# Altium schematic sheet Power_Hi_Curr.SchDoc
size A3; Organization: Altium Limited; Address1: L3, 12a Rodborough Rd; Address2: Frenchs Forest; Address3: NSW; Address4: Australia 2086
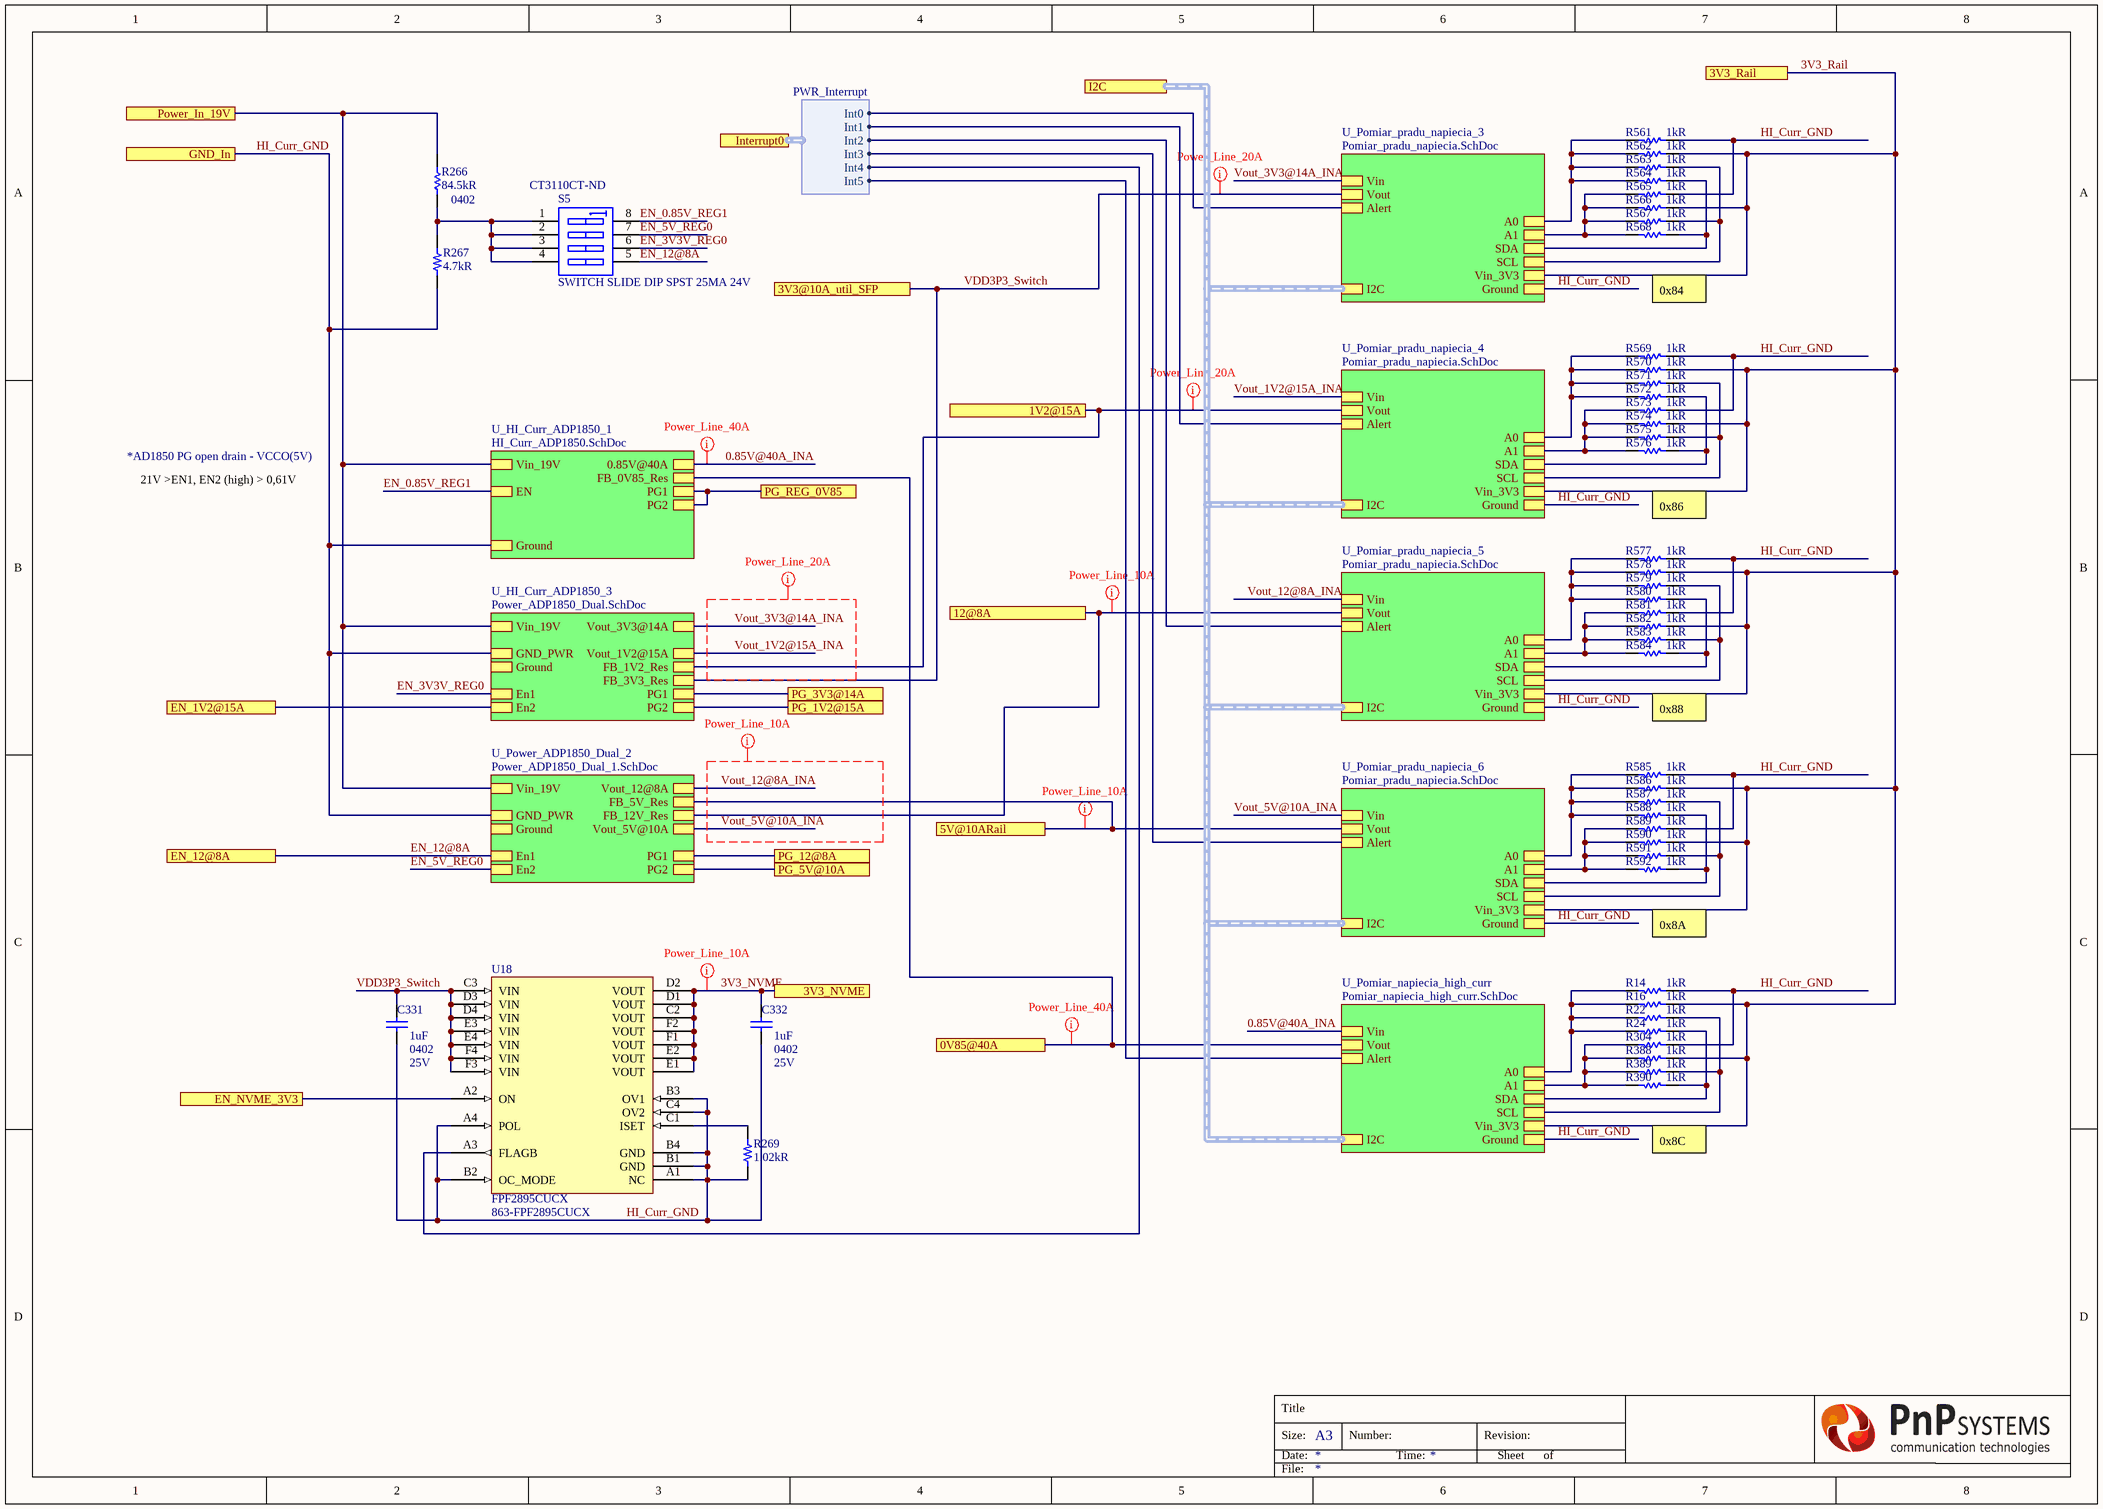
[diagram p0: Power_Hi_Curr.SchDoc]

## Parts
C331  1uF  Case/Package: 0402  Voltage Rating: 25V  [CAP 0402/1005 KK]
C332  1uF  Case/Package: 0402  Voltage Rating: 25V  [CAP 0402/1005 KK]
R14  1kR  [RES 0402/1005 RF KK]
R16  1kR  [RES 0402/1005 RF KK]
R22  1kR  [RES 0402/1005 RF KK]
R24  1kR  [RES 0402/1005 RF KK]
R266  84.5kR  Case/Package: 0402  [RES 0402/1005 RF KK]
R267  4.7kR  [RES 0402/1005 RF KK]
R269  1.02kR  [RES 0402/1005 RF KK]
R304  1kR  [RES 0402/1005 RF KK]
R388  1kR  [RES 0402/1005 RF KK]
R389  1kR  [RES 0402/1005 RF KK]
R390  1kR  [RES 0402/1005 RF KK]
R561  1kR  [RES 0402/1005 RF KK]
R562  1kR  [RES 0402/1005 RF KK]
R563  1kR  [RES 0402/1005 RF KK]
R564  1kR  [RES 0402/1005 RF KK]
R565  1kR  [RES 0402/1005 RF KK]
R566  1kR  [RES 0402/1005 RF KK]
R567  1kR  [RES 0402/1005 RF KK]
R568  1kR  [RES 0402/1005 RF KK]
R569  1kR  [RES 0402/1005 RF KK]
R570  1kR  [RES 0402/1005 RF KK]
R571  1kR  [RES 0402/1005 RF KK]
R572  1kR  [RES 0402/1005 RF KK]
R573  1kR  [RES 0402/1005 RF KK]
R574  1kR  [RES 0402/1005 RF KK]
R575  1kR  [RES 0402/1005 RF KK]
R576  1kR  [RES 0402/1005 RF KK]
R577  1kR  [RES 0402/1005 RF KK]
R578  1kR  [RES 0402/1005 RF KK]
R579  1kR  [RES 0402/1005 RF KK]
R580  1kR  [RES 0402/1005 RF KK]
R581  1kR  [RES 0402/1005 RF KK]
R582  1kR  [RES 0402/1005 RF KK]
R583  1kR  [RES 0402/1005 RF KK]
R584  1kR  [RES 0402/1005 RF KK]
R585  1kR  [RES 0402/1005 RF KK]
R586  1kR  [RES 0402/1005 RF KK]
R587  1kR  [RES 0402/1005 RF KK]
R588  1kR  [RES 0402/1005 RF KK]
R589  1kR  [RES 0402/1005 RF KK]
R590  1kR  [RES 0402/1005 RF KK]
R591  1kR  [RES 0402/1005 RF KK]
R592  1kR  [RES 0402/1005 RF KK]
S5  SWITCH SLIDE DIP SPST 25MA 24V  Supplier Part Number 1: CT3110CT-ND  [SO8_N]
U18  FPF2895CUCX  Supplier Part Number 1: 863-FPF2895CUCX  [FPF2895C-D]

## Sub-sheets
U_HI_Curr_ADP1850_1 = HI_Curr_ADP1850.SchDoc: Ground, Vin_19V, PG2, PG1, 0.85V@40A, EN, FB_0V85_Res
U_HI_Curr_ADP1850_3 = Power_ADP1850_Dual.SchDoc: Ground, Vin_19V, GND_PWR, En2, En1, Vout_1V2@15A, PG2, PG1, Vout_3V3@14A, FB_1V2_Res, FB_3V3_Res
U_Pomiar_napiecia_high_curr = Pomiar_napiecia_high_curr.SchDoc: Vin_3V3, Vin, Vout, Alert, A0, A1, SDA, SCL, Ground, I2C (harness I2C)
U_Pomiar_pradu_napiecia_3 = Pomiar_pradu_napiecia.SchDoc: Vin_3V3, Vin, Vout, Alert, A0, A1, SDA, SCL, Ground, I2C (harness I2C)
U_Pomiar_pradu_napiecia_4 = Pomiar_pradu_napiecia.SchDoc: Vin_3V3, Vin, Vout, Alert, A0, A1, SDA, SCL, Ground, I2C (harness I2C)
U_Pomiar_pradu_napiecia_5 = Pomiar_pradu_napiecia.SchDoc: Vin_3V3, Vin, Vout, Alert, A0, A1, SDA, SCL, Ground, I2C (harness I2C)
U_Pomiar_pradu_napiecia_6 = Pomiar_pradu_napiecia.SchDoc: Vin_3V3, Vin, Vout, Alert, A0, A1, SDA, SCL, Ground, I2C (harness I2C)
U_Power_ADP1850_Dual_2 = Power_ADP1850_Dual_1.SchDoc: Vin_19V, Ground, GND_PWR, En1, En2, PG1, PG2, Vout_12@8A, Vout_5V@10A, FB_5V_Res, FB_12V_Res

## Ports
0V85@40A, 1V2@15A, 3V3@10A_util_SFP, 3V3_NVME, 3V3_Rail, 5V@10ARail, 12@8A, EN_1V2@15A, EN_12@8A, EN_NVME_3V3, GND_In, I2C (harness I2C), Interrupt0 (harness PWR_Interrupt), PG_1V2@15A, PG_3V3@14A, PG_5V@10A, PG_12@8A, PG_REG_0V85, Power_In_19V

## Harnesses
PWR_Interrupt: Int0, Int1, Int2, Int3, Int4, Int5

## Nets
0.85V@40A_INA: sheet U_HI_Curr_ADP1850_1/0.85V@40A, sheet U_Pomiar_napiecia_high_curr/Vin
0V85@40A: port 0V85@40A, sheet U_HI_Curr_ADP1850_1/FB_0V85_Res, sheet U_Pomiar_napiecia_high_curr/Vout
1V2@15A: port 1V2@15A, sheet U_HI_Curr_ADP1850_3/FB_1V2_Res, sheet U_Pomiar_pradu_napiecia_4/Vout
3V3_NVME: C332.1 U18.C2(VOUT) U18.D1(VOUT) U18.D2(VOUT) U18.E1(VOUT) U18.E2(VOUT) U18.F1(VOUT) U18.F2(VOUT) ; port 3V3_NVME
3V3_Rail: R16.2 R388.2 R562.2 R566.2 R570.2 R574.2 R578.2 R582.2 R586.2 R590.2 ; port 3V3_Rail, sheet U_Pomiar_pradu_napiecia_3/Vin_3V3, sheet U_Pomiar_pradu_napiecia_4/Vin_3V3, sheet U_Pomiar_pradu_napiecia_5/Vin_3V3, sheet U_Pomiar_pradu_napiecia_6/Vin_3V3, sheet U_Pomiar_napiecia_high_curr/Vin_3V3
5V@10ARail: port 5V@10ARail, sheet U_Power_ADP1850_Dual_2/FB_5V_Res, sheet U_Pomiar_pradu_napiecia_6/Vout
12@8A: port 12@8A, sheet U_Power_ADP1850_Dual_2/FB_12V_Res, sheet U_Pomiar_pradu_napiecia_5/Vout
EN_0.85V_REG1: S5.8(B1) ; sheet U_HI_Curr_ADP1850_1/EN
EN_1V2@15A: port EN_1V2@15A, sheet U_HI_Curr_ADP1850_3/En2
EN_3V3V_REG0: S5.6(B3) ; sheet U_HI_Curr_ADP1850_3/En1
EN_5V_REG0: S5.7(B2) ; sheet U_Power_ADP1850_Dual_2/En2
EN_12@8A: S5.5(B4) ; port EN_12@8A, sheet U_Power_ADP1850_Dual_2/En1
EN_NVME_3V3: U18.A2(ON) ; port EN_NVME_3V3
HI_Curr_GND: C331.2 C332.2 R14.2 R267.1 R269.1 R304.2 R561.2 R565.2 R569.2 R573.2 R577.2 R581.2 R585.2 R589.2 U18.A1(NC) U18.A4(POL) U18.B1(GND) U18.B2(OC_MODE) U18.B3(OV1) U18.B4(GND) U18.C4(OV2) ; port GND_In, sheet U_HI_Curr_ADP1850_1/Ground, sheet U_HI_Curr_ADP1850_3/GND_PWR, sheet U_Power_ADP1850_Dual_2/GND_PWR, sheet U_Pomiar_pradu_napiecia_3/Ground, sheet U_Pomiar_pradu_napiecia_4/Ground, sheet U_Pomiar_pradu_napiecia_5/Ground, sheet U_Pomiar_pradu_napiecia_6/Ground, sheet U_Pomiar_napiecia_high_curr/Ground
PG_1V2@15A: port PG_1V2@15A, sheet U_HI_Curr_ADP1850_3/PG2
PG_3V3@14A: port PG_3V3@14A, sheet U_HI_Curr_ADP1850_3/PG1
PG_5V@10A: port PG_5V@10A, sheet U_Power_ADP1850_Dual_2/PG2
PG_12@8A: port PG_12@8A, sheet U_Power_ADP1850_Dual_2/PG1
PG_REG_0V85: port PG_REG_0V85, sheet U_HI_Curr_ADP1850_1/PG2, sheet U_HI_Curr_ADP1850_1/PG1
Power_In_19V: R266.2 ; port Power_In_19V, sheet U_HI_Curr_ADP1850_1/Vin_19V, sheet U_HI_Curr_ADP1850_3/Vin_19V, sheet U_Power_ADP1850_Dual_2/Vin_19V
VDD3P3_Switch: C331.1 U18.C3(VIN) U18.D3(VIN) U18.D4(VIN) U18.E3(VIN) U18.E4(VIN) U18.F3(VIN) U18.F4(VIN) ; port 3V3@10A_util_SFP, sheet U_HI_Curr_ADP1850_3/FB_3V3_Res, sheet U_Pomiar_pradu_napiecia_3/Vout
Vout_1V2@15A_INA: sheet U_HI_Curr_ADP1850_3/Vout_1V2@15A, sheet U_Pomiar_pradu_napiecia_4/Vin
Vout_3V3@14A_INA: sheet U_HI_Curr_ADP1850_3/Vout_3V3@14A, sheet U_Pomiar_pradu_napiecia_3/Vin
Vout_5V@10A_INA: sheet U_Power_ADP1850_Dual_2/Vout_5V@10A, sheet U_Pomiar_pradu_napiecia_6/Vin
Vout_12@8A_INA: sheet U_Power_ADP1850_Dual_2/Vout_12@8A, sheet U_Pomiar_pradu_napiecia_5/Vin
NetR14_1: R14.1 R16.1 R22.1 R24.1 ; sheet U_Pomiar_napiecia_high_curr/A0
NetR22_2: R22.2 R389.2 ; sheet U_Pomiar_napiecia_high_curr/SCL
NetR24_2: R24.2 R390.2 ; sheet U_Pomiar_napiecia_high_curr/SDA
NetR266_1: R266.1 R267.2 S5.1(A1) S5.2(A2) S5.3(A3) S5.4(A4)
NetR269_2: R269.2 U18.C1(ISET)
NetR304_1: R304.1 R388.1 R389.1 R390.1 ; sheet U_Pomiar_napiecia_high_curr/A1
NetR561_1: R561.1 R562.1 R563.1 R564.1 ; sheet U_Pomiar_pradu_napiecia_3/A0
NetR563_2: R563.2 R567.2 ; sheet U_Pomiar_pradu_napiecia_3/SCL
NetR564_2: R564.2 R568.2 ; sheet U_Pomiar_pradu_napiecia_3/SDA
NetR565_1: R565.1 R566.1 R567.1 R568.1 ; sheet U_Pomiar_pradu_napiecia_3/A1
NetR569_1: R569.1 R570.1 R571.1 R572.1 ; sheet U_Pomiar_pradu_napiecia_4/A0
NetR571_2: R571.2 R575.2 ; sheet U_Pomiar_pradu_napiecia_4/SCL
NetR572_2: R572.2 R576.2 ; sheet U_Pomiar_pradu_napiecia_4/SDA
NetR573_1: R573.1 R574.1 R575.1 R576.1 ; sheet U_Pomiar_pradu_napiecia_4/A1
NetR577_1: R577.1 R578.1 R579.1 R580.1 ; sheet U_Pomiar_pradu_napiecia_5/A0
NetR579_2: R579.2 R583.2 ; sheet U_Pomiar_pradu_napiecia_5/SCL
NetR580_2: R580.2 R584.2 ; sheet U_Pomiar_pradu_napiecia_5/SDA
NetR581_1: R581.1 R582.1 R583.1 R584.1 ; sheet U_Pomiar_pradu_napiecia_5/A1
NetR585_1: R585.1 R586.1 R587.1 R588.1 ; sheet U_Pomiar_pradu_napiecia_6/A0
NetR587_2: R587.2 R591.2 ; sheet U_Pomiar_pradu_napiecia_6/SCL
NetR588_2: R588.2 R592.2 ; sheet U_Pomiar_pradu_napiecia_6/SDA
NetR589_1: R589.1 R590.1 R591.1 R592.1 ; sheet U_Pomiar_pradu_napiecia_6/A1
NetU18_A3: U18.A3(FLAGB) ; port Interrupt0.Int4
(unnamed): sheet U_Pomiar_pradu_napiecia_3/Alert, port Interrupt0.Int0
(unnamed): sheet U_Pomiar_pradu_napiecia_4/Alert, port Interrupt0.Int1
(unnamed): sheet U_Pomiar_pradu_napiecia_5/Alert, port Interrupt0.Int2
(unnamed): sheet U_Pomiar_pradu_napiecia_6/Alert, port Interrupt0.Int3
(unnamed): sheet U_Pomiar_napiecia_high_curr/Alert, port Interrupt0.Int5

## Buses and harness runs
harness port I2C = sheet U_Pomiar_napiecia_high_curr/I2C = sheet U_Pomiar_pradu_napiecia_3/I2C = sheet U_Pomiar_pradu_napiecia_4/I2C = sheet U_Pomiar_pradu_napiecia_5/I2C = sheet U_Pomiar_pradu_napiecia_6/I2C

## Layout directives
net class Power_Line_40A: 0.85V@40A_INA, 0V85@40A
net class Power_Line_20A: 1V2@15A, VDD3P3_Switch, Vout_1V2@15A_INA, Vout_3V3@14A_INA
net class Power_Line_10A: 3V3_NVME, 5V@10ARail, 12@8A, Vout_5V@10A_INA, Vout_12@8A_INA

## Notes on the sheet
- 0x84
- *AD1850 PG open drain - VCCO(5V)
- 21V >EN1, EN2 (high) > 0,61V
- 0x86
- 0x88
- 0x8A
- 0x8C
- Title
- Size:
- Date:
- A3
- Number:
- Time:
- Revision:
- Sheet
- of
- File:

## Library data of the parts
C331 C332 = Capacitor: MURATA - GRT155R61E105KE01D - SMD Multilayer Ceramic Capacitor, 1 µF, 25 V, 0402 [1005 Metric], ± 10%, X5R, GRT Series - SMD Multilayer Ceramic Capacitor, 1 µF, 25 V, 0402 [1005 Metric], ± 10%, X5R, GRT Series; Supplier 1: Digi-Key; Supplier Part Number 1: 490-12263-1-ND; Manufacturer: Murata; Manufacturer Part Number: GRT155R61E105KE01D; RoHS: Yes; Category: Ceramic Capacitors; Stock 1: 341453; Pricing 1: 1=0,18000, 10=0,12300, 100=0,06210, 500=0,04248, 1000=0,03758, 2500=0,03594, 5000=0,03268 (USD); Mount: Surface Mount; Case Code (Metric): 1005; Case Code (Imperial): 0402; Min Operating Temperature: -55°C; Max Operating Temperature: 85°C; Packaging: Tape and Reel; Capacitance: 1uF; Tolerance: 10%; Dielectric: X5R; Voltage Rating (DC): 25V; Length: 0.039inch; Width: 0.02inch; Thickness: 0.022inch; Ratings: AEC-Q200; ComponentLink1URL: http://www.farnell.com/datasheets/2165918.pdf?src-supplier=Farnell; ComponentLink1Description: http://www.farnell.com/datasheets/2165918.pdf?src-supplier=Farnell; ComponentLink2URL: http://search.murata.co.jp/Ceramy/image/img/A01X/G101/ENG/GRT155R61E105KE01-01.pdf?src-supplier=Digi-Key; ComponentLink2Description: http://search.murata.co.jp/Ceramy/image/img/A01X/G101/ENG/GRT155R61E105KE01-01.pdf?src-supplier=Digi-Key; ComponentLink3URL: http://www.farnell.com/datasheets/2165918.pdf?src-supplier=Element14; ComponentLink3Description: http://www.farnell.com/datasheets/2165918.pdf?src-supplier=Element14
R14 R16 R22 R24 R304 R388-R390 R561-R592 = Resistor: PANASONIC - ERJ-2RKF1001X - SMD Chip Resistor, 0402 [1005 Metric], 1 kohm, ERJ2R Series, 50 V, Thick Film, 100 mW; Temperature Coefficient: 100ppm/°C; Tolerance: 1%; Voltage Rating (DC): 50V; Power Rating: 100mW; Supplier 1: Digi-Key; Supplier Part Number 1: P1.00KLDKR-ND; Manufacturer: Panasonic; Manufacturer Part Number: ERJ-2RKF1001X; RoHS: Yes; Category: Chip SMD Resistors; Stock 1: 1864188; Pricing 1: 1=0,10000, 10=0,04300, 100=0,01740, 1000=0,00782, 2500=0,00678, 5000=0,00561 (USD); Mount: Surface Mount; Case/Package: 0402; Number of Pins: 2; Contact Plating: Tin; Case Code (Imperial): 0402; Case Code (Metric): 1005; Min Operating Temperature: -55°C; Max Operating Temperature: 155°C; Composition: Thick Film; Resistance: 1kR; Termination: SMD/SMT; Number of Terminations: 2; Military Standard: Not; Features: Automotive AEC-Q200; Packaging: Tape and Reel; Voltage Rating: 50V; Package Quantity: 1; Max Power Dissipation: 100mW; Working Voltage: 50V; Length: 1mm; Height: 0.35mm; Depth: 0.5mm; Width: 0.5mm; Radiation Hardening: No; Lead Free: Lead Free; REACH SVHC: No SVHC; ComponentLink1URL: https://datasheet.ciiva.com/11821/0900766b80f80784-11821203.pdf?src-supplier=RSComponents; ComponentLink1Description: https://datasheet.ciiva.com/11821/0900766b80f80784-11821203.pdf?src-supplier=RSComponents; ComponentLink2URL: https://datasheet.ciiva.com/7942/aoa0000ce2-7942426.pdf?src-supplier=Element14; ComponentLink2Description: https://datasheet.ciiva.com/7942/aoa0000ce2-7942426.pdf?src-supplier=Element14; ComponentLink3URL: https://datasheet.ciiva.com/16523/aoa0000ce2-16523834.pdf?src-supplier=Avnet+Asia; ComponentLink3Description: https://datasheet.ciiva.com/16523/aoa0000ce2-16523834.pdf?src-supplier=Avnet+Asia; ComponentLink4URL: https://datasheet.ciiva.com/17215/aoa0000ce2-17215308.pdf?src-supplier=Avnet+Europe; ComponentLink4Description: https://datasheet.ciiva.com/17215/aoa0000ce2-17215308.pdf?src-supplier=Avnet+Europe; ComponentLink5URL: https://datasheet.ciiva.com/22673/1678782-22673916.pdf?src-supplier=Element14; ComponentLink5Description: https://datasheet.ciiva.com/22673/1678782-22673916.pdf?src-supplier=Element14; ComponentLink6URL: https://datasheet.ciiva.com/28532/1678782-28532109.pdf?src-supplier=Element14; ComponentLink6Description: https://datasheet.ciiva.com/28532/1678782-28532109.pdf?src-supplier=Element14; ComponentLink7URL: https://datasheet.ciiva.com/16767/70260748-16767559.pdf?src-supplier=Allied+Electronics; ComponentLink7Description: https://datasheet.ciiva.com/16767/70260748-16767559.pdf?src-supplier=Allied+Electronics; ComponentLink8URL: https://datasheet.ciiva.com/9198/aoa0000ce2-9198920.pdf?src-supplier=Avnet; ComponentLink8Description: https://datasheet.ciiva.com/9198/aoa0000ce2-9198920.pdf?src-supplier=Avnet; ComponentLink9URL: https://datasheet.ciiva.com/16771/70260748-16771979.pdf?src-supplier=Allied+Electronics; ComponentLink9Description: https://datasheet.ciiva.com/16771/70260748-16771979.pdf?src-supplier=Allied+Electronics
R266 = Resistor: Thick Film Resistors - SMD 84.5K OHM 1%; Manufacturer: Yageo; Manufacturer Part Number: RC0402FR-0784K5L; Power Rating: 62.5mW; Voltage Rating: 50V; Temperature Coefficient: 100ppm/°C; Max Power Dissipation: 63mW; Supplier 1: Digi-Key; Supplier Part Number 1: YAG3245CT-ND; RoHS: Yes; Category: Chip SMD Resistors; Stock 1: 1119527; Pricing 1: 1=0,10000, 10=0,01600, 100=0,00640, 1000=0,00289, 2500=0,00251, 5000=0,00207 (USD); Case Code (Imperial): 0402; Case Code (Metric): 1005; Contact Plating: Tin,Matte; Min Operating Temperature: -55°C; Max Operating Temperature: 155°C; Tolerance: 1%; Packaging: Tape and Reel; Resistance: 84.5kR; Composition: Thick Film; Number of Terminations: 2; Termination: SMD/SMT; Military Standard: Not; Voltage Rating (DC): 50V; Working Voltage: 50V; Features: Moisture Resistant; Length: 1mm; Height: 0.016inch; Width: 0.02inch; Depth: 0.5mm; Lead Free: Lead Free; ComponentLink1URL: https://datasheet.ciiva.com/16743/pyu-rc0402-51-rohs-l-6-r-16743877.pdf?src-supplier=Future+Electronics; ComponentLink1Description: https://datasheet.ciiva.com/16743/pyu-rc0402-51-rohs-l-6-r-16743877.pdf?src-supplier=Future+Electronics; ComponentLink2URL: https://datasheet.ciiva.com/16857/pyu-rc0402-51-rohs-l-6-16857805.pdf?src-supplier=Avnet+Europe; ComponentLink2Description: https://datasheet.ciiva.com/16857/pyu-rc0402-51-rohs-l-6-16857805.pdf?src-supplier=Avnet+Europe; ComponentLink3URL: https://datasheet.ciiva.com/28396/pyu-rc0402-51-rohs-l-6-28396296.pdf?src-supplier=Avnet+Europe; ComponentLink3Description: https://datasheet.ciiva.com/28396/pyu-rc0402-51-rohs-l-6-28396296.pdf?src-supplier=Avnet+Europe; ComponentLink4URL: https://datasheet.ciiva.com/8888/pyu-rc0402-51-rohs-l-6-8888111.pdf?src-supplier=Avnet; ComponentLink4Description: https://datasheet.ciiva.com/8888/pyu-rc0402-51-rohs-l-6-8888111.pdf?src-supplier=Avnet
R267 = Resistor: Manufacturer: Panasonic; Manufacturer Part Number: ERJ-2RKF4701X; Tolerance: 1%; Temperature Coefficient: 100ppm/°C; Power Rating: 100mW; Voltage Rating: 50V; Supplier 1: Digi-Key; Supplier Part Number 1: P4.70KLCT-ND; Stock 1: 5361977; Pricing 1: 1 = 0,10000, 10 = 0,05500, 100 = 0,02250, 1000 = 0,01009, 2500 = 0,00876, 5000 = 0,00724 (USD); RoHS: Yes; Mount: Surface Mount; Case/Package: 0402; Number of Pins: 2; Case Code (Imperial): 0402; Case Code (Metric): 1005; Contact Plating: Tin; Min Operating Temperature: -55°C; Max Operating Temperature: 155°C; Resistance: 4.7kR; Packaging: Tape and Reel; Composition: Thick Film; Package Quantity: 1; Termination: SMD/SMT; Voltage Rating (DC): 50V; Number of Terminations: 2; Military Standard: Not; Max Power Dissipation: 100mW; Features: Automotive AEC-Q200; Length: 1mm; Height: 0.35mm; Width: 0.02inch; Depth: 0.5mm; Radiation Hardening: No; Lead Free: Lead Free; REACH SVHC: No SVHC; ComponentLink1URL: https://datasheet.ciiva.com/11821/0900766b80f80784-11821329.pdf?src-supplier=RSComponents; ComponentLink1Description: https://datasheet.ciiva.com/11821/0900766b80f80784-11821329.pdf?src-supplier=RSComponents; ComponentLink2URL: https://datasheet.ciiva.com/30053/aoa0000ce2-30053990.pdf?src-supplier=Onlinecomponents.com; ComponentLink2Description: https://datasheet.ciiva.com/30053/aoa0000ce2-30053990.pdf?src-supplier=Onlinecomponents.com; ComponentLink3URL: https://datasheet.ciiva.com/7830/aoa0000ce2-7830727.pdf?src-supplier=Element14; ComponentLink3Description: https://datasheet.ciiva.com/7830/aoa0000ce2-7830727.pdf?src-supplier=Element14; ComponentLink4URL: https://datasheet.ciiva.com/22781/1678782-22781576.pdf?src-supplier=Farnell; ComponentLink4Description: https://datasheet.ciiva.com/22781/1678782-22781576.pdf?src-supplier=Farnell; ComponentLink5URL: https://datasheet.ciiva.com/9195/aoa0000ce2-9195737.pdf?src-supplier=Avnet; ComponentLink5Description: https://datasheet.ciiva.com/9195/aoa0000ce2-9195737.pdf?src-supplier=Avnet; ComponentLink6URL: https://datasheet.ciiva.com/17213/aoa0000ce2-17213180.pdf?src-supplier=Avnet+Europe; ComponentLink6Description: https://datasheet.ciiva.com/17213/aoa0000ce2-17213180.pdf?src-supplier=Avnet+Europe; ComponentLink7URL: https://datasheet.ciiva.com/22667/1678782-22667886.pdf?src-supplier=Element14; ComponentLink7Description: https://datasheet.ciiva.com/22667/1678782-22667886.pdf?src-supplier=Element14; ComponentLink8URL: https://datasheet.ciiva.com/16763/70260748-16763151.pdf?src-supplier=Allied+Electronics; ComponentLink8Description: https://datasheet.ciiva.com/16763/70260748-16763151.pdf?src-supplier=Allied+Electronics; ComponentLink9URL: https://datasheet.ciiva.com/22723/1678782-22723903.pdf?src-supplier=Element14; ComponentLink9Description: https://datasheet.ciiva.com/22723/1678782-22723903.pdf?src-supplier=Element14; ComponentLink10URL: https://datasheet.ciiva.com/24025/aoa0000ce2-24025663.pdf?src-supplier=Mouser; ComponentLink10Description: https://datasheet.ciiva.com/24025/aoa0000ce2-24025663.pdf?src-supplier=Mouser
R269 = Resistor: Manufacturer: Panasonic; Manufacturer Part Number: ERJ-2RKF1021X; Tolerance: 1%; Temperature Coefficient: 100ppm/°C; Power Rating: 100mW; Voltage Rating: 50V; Supplier 1: Digi-Key; Supplier Part Number 1: P1.02KLCT-ND; Stock 1: 88589; Pricing 1: 1 = 0,10000, 10 = 0,04300, 100 = 0,01750, 1000 = 0,00787, 2500 = 0,00683, 5000 = 0,00564 (USD); RoHS: Yes; Mount: Surface Mount; Case/Package: 0402; Case Code (Metric): 1005; Case Code (Imperial): 0402; Contact Plating: Tin; Min Operating Temperature: -55°C; Max Operating Temperature: 155°C; Resistance: 1.02kR; Packaging: Tape and Reel; Composition: Thick Film; Number of Terminations: 2; Voltage Rating (DC): 50V; Max Power Dissipation: 100mW; Features: Automotive AEC-Q200; Package Quantity: 1; Termination: SMD/SMT; Military Standard: Not; Length: 1mm; Height: 0.35mm; Width: 0.02inch; Depth: 0.5mm; REACH SVHC: No SVHC; Lead Free: Lead Free; ComponentLink1URL: https://datasheet.ciiva.com/16760/70260748-16760677.pdf?src-supplier=Allied+Electronics; ComponentLink1Description: https://datasheet.ciiva.com/16760/70260748-16760677.pdf?src-supplier=Allied+Electronics; ComponentLink2URL: https://datasheet.ciiva.com/24026/aoa0000ce2-24026598.pdf?src-supplier=Mouser; ComponentLink2Description: https://datasheet.ciiva.com/24026/aoa0000ce2-24026598.pdf?src-supplier=Mouser; ComponentLink3URL: https://datasheet.ciiva.com/22743/1678782-22743480.pdf?src-supplier=Farnell; ComponentLink3Description: https://datasheet.ciiva.com/22743/1678782-22743480.pdf?src-supplier=Farnell; ComponentLink4URL: https://datasheet.ciiva.com/16778/70260748-16778748.pdf?src-supplier=Allied+Electronics; ComponentLink4Description: https://datasheet.ciiva.com/16778/70260748-16778748.pdf?src-supplier=Allied+Electronics; ComponentLink5URL: https://datasheet.ciiva.com/22682/1678782-22682413.pdf?src-supplier=Element14; ComponentLink5Description: https://datasheet.ciiva.com/22682/1678782-22682413.pdf?src-supplier=Element14; ComponentLink6URL: https://datasheet.ciiva.com/46373/1678782-46373838.pdf?src-supplier=Element14; ComponentLink6Description: https://datasheet.ciiva.com/46373/1678782-46373838.pdf?src-supplier=Element14; ComponentLink7URL: https://datasheet.ciiva.com/46373/1678782-46373839.pdf?src-supplier=Element14; ComponentLink7Description: https://datasheet.ciiva.com/46373/1678782-46373839.pdf?src-supplier=Element14
S5 = SW DIP-4: Manufacturer: CTS; Manufacturer Part Number: 218-4LPSTR; Mechanical Life: 1000Cycles; Actuator Type: Slide (Standard); Number of Positions: 4; Pitch: 0.05inch; Washable: Yes; Published: 24-Mar-1999; LatestRevisionDate: 29-May-2009; LatestRevisionNote: IPC-7351 Footprint Added.; PackageVersion: Dec-2002; PackageReference: SO8; Publisher: Altium Limited; PackageDescription: 8-Pin Small Outline Integrated Circuit 1.27 mm Pitch; Code_JEDEC: MS-012-AA; Code_IPC: SOIC127P600-8; Supplier 1: Digi-Key; RoHS: Yes; Category: DIP Switches; Stock 1: 21553; Pricing 1: 1=1,33000, 10=1,28000, 25=1,20280, 100=1,03910, 250=0,94696, 500=0,88040, 1000=0,81898 (USD); Mount: Surface Mount; Contact Material: Copper; Contact Plating: Gold; Min Operating Temperature: -55°C; Max Operating Temperature: 85°C; Orientation: Straight; Packaging: Tape and Reel; Throw Configuration: SPST; Voltage Rating (DC): 24V; Package Quantity: 2000; Max Voltage Rating (DC): 24V; Max Current Rating: 25mA; Termination: Gull Wing; Current Rating: 25mA; Electrical Life: 1000Cycles; Length: 0.246inch; Depth: 8.44mm; Radiation Hardening: No; Lead Free: Lead Free; ComponentLink1URL: https://datasheet.ciiva.com/8676/218-8676896.pdf?src-supplier=Avnet; ComponentLink1Description: https://datasheet.ciiva.com/8676/218-8676896.pdf?src-supplier=Avnet; ComponentLink2URL: https://datasheet.ciiva.com/8082/218-8082342.pdf?src-supplier=Avnet; ComponentLink2Description: https://datasheet.ciiva.com/8082/218-8082342.pdf?src-supplier=Avnet; ComponentLink3URL: https://datasheet.ciiva.com/16303/218-16303941.pdf?src-supplier=Future+Electronics; ComponentLink3Description: https://datasheet.ciiva.com/16303/218-16303941.pdf?src-supplier=Future+Electronics; ComponentLink4URL: https://datasheet.ciiva.com/15184/getdatasheetpartid-141001-15184860.pdf?src-supplier=Verical; ComponentLink4Description: https://datasheet.ciiva.com/15184/getdatasheetpartid-141001-15184860.pdf?src-supplier=Verical
U18 = FPF2895CUCX: Current Limit Load Switch with OVP and TRCB, 28 V, 5 A; Manufacturer 1: ON Semiconductor; Supplier 1: Mouser; Manufacturer Part Number 1: FPF2895CUCX; Stock 1: 808; Pricing 1: 1=2,18000, 10=1,85000, 100=1,48000, 500=1,29000, 1000=1,07000, 3000=1,00000, 6000=0,96500, 9000=0,92800, 24000=0,89200 (USD); RoHS: No